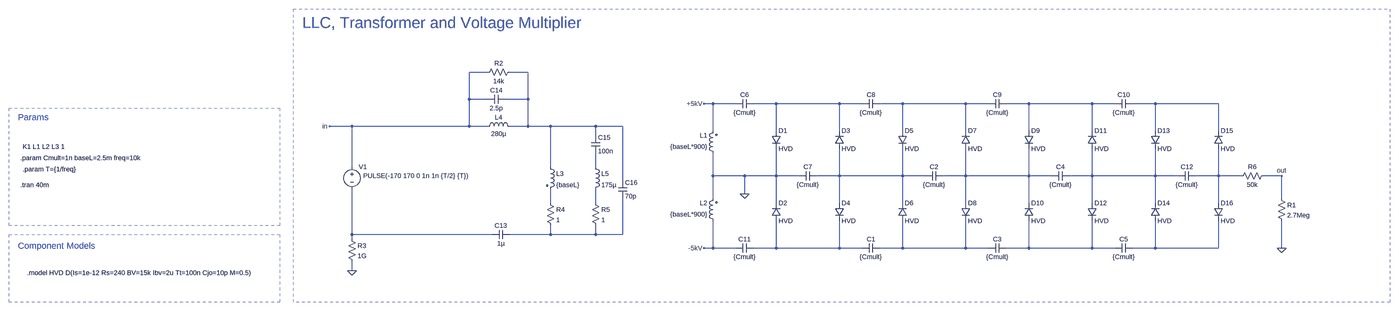
[diagram p0: schematic LLC_Parasitics_Multiplier.asc, whole sheet]
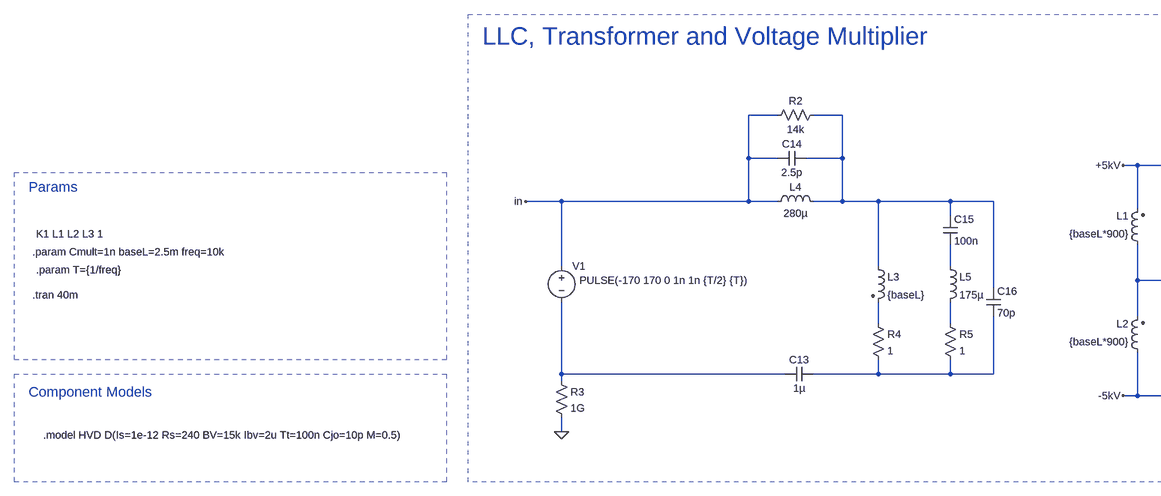
[diagram p1: schematic LLC_Parasitics_Multiplier.asc, part, row 1 of 1, column 1 of 2]
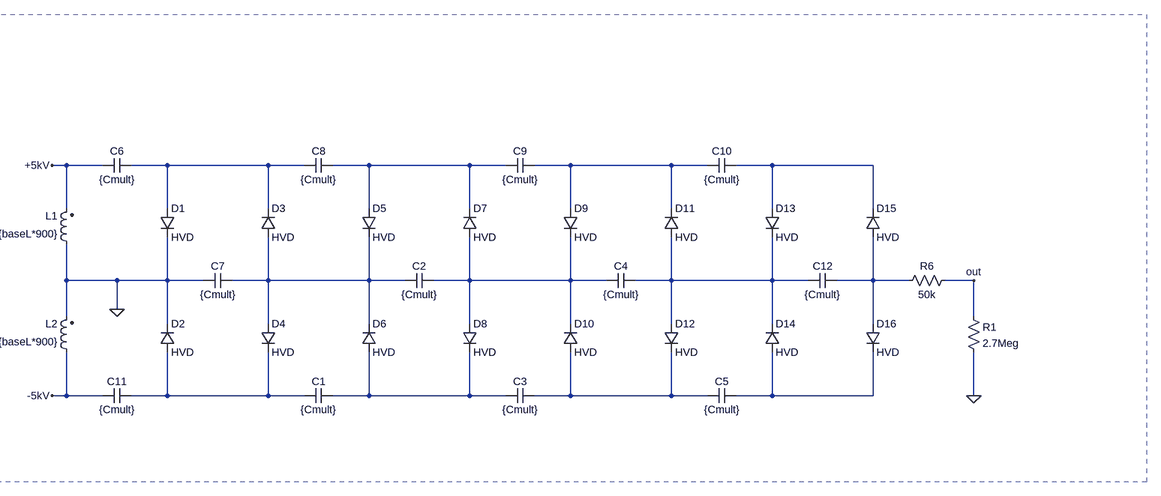
[diagram p2: schematic LLC_Parasitics_Multiplier.asc, part, row 1 of 1, column 2 of 2]
LLC_Parasitics_Multiplier.asc, the LTspice schematic file:
Version 4.1
SHEET 1 2716 1108
WIRE -784 -144 -848 -144
WIRE -640 -144 -704 -144
WIRE -848 -48 -848 -144
WIRE -784 -48 -848 -48
WIRE -640 -48 -640 -144
WIRE -640 -48 -720 -48
WIRE 16 -32 -16 -32
WIRE 96 -32 16 -32
WIRE 240 -32 160 -32
WIRE 464 -32 240 -32
WIRE 544 -32 464 -32
WIRE 688 -32 608 -32
WIRE 912 -32 688 -32
WIRE 992 -32 912 -32
WIRE 1136 -32 1056 -32
WIRE 1360 -32 1136 -32
WIRE 1440 -32 1360 -32
WIRE 1584 -32 1504 -32
WIRE 1808 -32 1584 -32
WIRE -1264 48 -1344 48
WIRE -848 48 -848 -48
WIRE -848 48 -1264 48
WIRE -784 48 -848 48
WIRE -640 48 -640 -48
WIRE -640 48 -704 48
WIRE -560 48 -640 48
WIRE -400 48 -560 48
WIRE -304 48 -400 48
WIRE 16 64 16 -32
WIRE 240 64 240 -32
WIRE 464 64 464 -32
WIRE 688 64 688 -32
WIRE 912 64 912 -32
WIRE 1136 64 1136 -32
WIRE 1360 64 1360 -32
WIRE 1584 64 1584 -32
WIRE 1808 64 1808 -32
WIRE -400 80 -400 48
WIRE -1264 192 -1264 48
WIRE -560 192 -560 48
WIRE -400 192 -400 144
WIRE 16 224 16 144
WIRE 128 224 16 224
WIRE 240 224 240 128
WIRE 240 224 128 224
WIRE 320 224 240 224
WIRE 464 224 464 128
WIRE 464 224 384 224
WIRE 688 224 688 128
WIRE 688 224 464 224
WIRE 768 224 688 224
WIRE 912 224 912 128
WIRE 912 224 832 224
WIRE 1136 224 1136 128
WIRE 1136 224 912 224
WIRE 1216 224 1136 224
WIRE 1360 224 1360 128
WIRE 1360 224 1280 224
WIRE 1584 224 1584 128
WIRE 1584 224 1360 224
WIRE 1664 224 1584 224
WIRE 1808 224 1808 128
WIRE 1808 224 1728 224
WIRE 1888 224 1808 224
WIRE 2032 224 1968 224
WIRE -304 240 -304 48
WIRE 128 288 128 224
WIRE 16 304 16 224
WIRE 2032 304 2032 224
WIRE -560 320 -560 272
WIRE -400 320 -400 272
WIRE 240 320 240 224
WIRE 464 320 464 224
WIRE 688 320 688 224
WIRE 912 320 912 224
WIRE 1136 320 1136 224
WIRE 1360 320 1360 224
WIRE 1584 320 1584 224
WIRE 1808 320 1808 224
WIRE -1264 432 -1264 272
WIRE -768 432 -1264 432
WIRE -560 432 -560 400
WIRE -560 432 -704 432
WIRE -400 432 -400 400
WIRE -400 432 -560 432
WIRE -304 432 -304 304
WIRE -304 432 -400 432
WIRE -1264 448 -1264 432
WIRE 16 480 16 384
WIRE 16 480 -16 480
WIRE 96 480 16 480
WIRE 240 480 240 384
WIRE 240 480 160 480
WIRE 464 480 464 384
WIRE 464 480 240 480
WIRE 544 480 464 480
WIRE 688 480 688 384
WIRE 688 480 608 480
WIRE 912 480 912 384
WIRE 912 480 688 480
WIRE 992 480 912 480
WIRE 1136 480 1136 384
WIRE 1136 480 1056 480
WIRE 1360 480 1360 384
WIRE 1360 480 1136 480
WIRE 1440 480 1360 480
WIRE 1584 480 1584 384
WIRE 1584 480 1504 480
WIRE 1808 480 1808 384
WIRE 1808 480 1584 480
WIRE 2032 480 2032 384
WIRE -1264 560 -1264 528
FLAG 2032 480 0
FLAG 128 288 0
FLAG -1344 48 in
FLAG 2032 224 out
FLAG -1264 560 0
FLAG -16 -32 +5kV
FLAG -16 480 -5kV
SYMBOL cap 608 464 R90
WINDOW 0 0 32 VBottom 2
WINDOW 3 32 32 VTop 2
SYMATTR InstName C1
SYMATTR Value {Cmult}
SYMBOL cap 832 240 M270
WINDOW 0 32 32 VTop 2
WINDOW 3 0 32 VBottom 2
SYMATTR InstName C2
SYMATTR Value {Cmult}
SYMBOL cap 1056 464 R90
WINDOW 0 0 32 VBottom 2
WINDOW 3 32 32 VTop 2
SYMATTR InstName C3
SYMATTR Value {Cmult}
SYMBOL res 2016 288 R0
SYMATTR InstName R1
SYMATTR Value 2.7Meg
SYMBOL cap 1280 240 M270
WINDOW 0 32 32 VTop 2
WINDOW 3 0 32 VBottom 2
SYMATTR InstName C4
SYMATTR Value {Cmult}
SYMBOL cap 1504 464 R90
WINDOW 0 0 32 VBottom 2
WINDOW 3 32 32 VTop 2
SYMATTR InstName C5
SYMATTR Value {Cmult}
SYMBOL cap 96 -16 R270
WINDOW 0 32 32 VTop 2
WINDOW 3 0 32 VBottom 2
SYMATTR InstName C6
SYMATTR Value {Cmult}
SYMBOL cap 384 208 R90
WINDOW 0 0 32 VBottom 2
WINDOW 3 32 32 VTop 2
SYMATTR InstName C7
SYMATTR Value {Cmult}
SYMBOL cap 608 -48 R90
WINDOW 0 0 32 VBottom 2
WINDOW 3 32 32 VTop 2
SYMATTR InstName C8
SYMATTR Value {Cmult}
SYMBOL cap 1056 -48 R90
WINDOW 0 0 32 VBottom 2
WINDOW 3 32 32 VTop 2
SYMATTR InstName C9
SYMATTR Value {Cmult}
SYMBOL cap 1504 -48 R90
WINDOW 0 0 32 VBottom 2
WINDOW 3 32 32 VTop 2
SYMATTR InstName C10
SYMATTR Value {Cmult}
SYMBOL cap 96 496 R270
WINDOW 0 32 32 VTop 2
WINDOW 3 0 32 VBottom 2
SYMATTR InstName C11
SYMATTR Value {Cmult}
SYMBOL cap 1728 240 M270
WINDOW 0 32 32 VTop 2
WINDOW 3 0 32 VBottom 2
SYMATTR InstName C12
SYMATTR Value {Cmult}
SYMBOL ind2 32 160 R180
WINDOW 0 36 80 Left 2
WINDOW 3 36 40 Left 2
SYMATTR InstName L1
SYMATTR Value {baseL*900}
SYMATTR Type ind
SYMBOL ind2 32 400 R180
WINDOW 0 36 80 Left 2
WINDOW 3 36 40 Left 2
SYMATTR InstName L2
SYMATTR Value {baseL*900}
SYMATTR Type ind
SYMBOL ind2 -576 176 R0
SYMATTR InstName L3
SYMATTR Value {baseL}
SYMATTR Type ind
SYMATTR SpiceLine Rser=1
SYMBOL diode 224 64 R0
SYMATTR InstName D1
SYMATTR Value HVD
SYMBOL diode 224 384 M180
WINDOW 0 24 64 Left 2
WINDOW 3 24 0 Left 2
SYMATTR InstName D2
SYMATTR Value HVD
SYMBOL diode 448 128 M180
WINDOW 0 24 64 Left 2
WINDOW 3 24 0 Left 2
SYMATTR InstName D3
SYMATTR Value HVD
SYMBOL diode 448 320 R0
SYMATTR InstName D4
SYMATTR Value HVD
SYMBOL diode 672 64 R0
SYMATTR InstName D5
SYMATTR Value HVD
SYMBOL diode 672 384 M180
WINDOW 0 24 64 Left 2
WINDOW 3 24 0 Left 2
SYMATTR InstName D6
SYMATTR Value HVD
SYMBOL diode 896 128 M180
WINDOW 0 24 64 Left 2
WINDOW 3 24 0 Left 2
SYMATTR InstName D7
SYMATTR Value HVD
SYMBOL diode 896 320 R0
SYMATTR InstName D8
SYMATTR Value HVD
SYMBOL diode 1120 64 R0
SYMATTR InstName D9
SYMATTR Value HVD
SYMBOL diode 1120 384 M180
WINDOW 0 24 64 Left 2
WINDOW 3 24 0 Left 2
SYMATTR InstName D10
SYMATTR Value HVD
SYMBOL diode 1344 128 M180
WINDOW 0 24 64 Left 2
WINDOW 3 24 0 Left 2
SYMATTR InstName D11
SYMATTR Value HVD
SYMBOL diode 1344 320 R0
SYMATTR InstName D12
SYMATTR Value HVD
SYMBOL diode 1568 64 R0
SYMATTR InstName D13
SYMATTR Value HVD
SYMBOL diode 1568 384 M180
WINDOW 0 24 64 Left 2
WINDOW 3 24 0 Left 2
SYMATTR InstName D14
SYMATTR Value HVD
SYMBOL diode 1792 128 M180
WINDOW 0 24 64 Left 2
WINDOW 3 24 0 Left 2
SYMATTR InstName D15
SYMATTR Value HVD
SYMBOL diode 1792 320 R0
SYMATTR InstName D16
SYMATTR Value HVD
SYMBOL ind -800 64 R270
WINDOW 0 32 56 VTop 2
WINDOW 3 5 56 VBottom 2
SYMATTR InstName L4
SYMATTR Value 280µ
SYMATTR SpiceLine Rser=1m
SYMBOL cap -704 416 R90
WINDOW 0 0 32 VBottom 2
WINDOW 3 32 32 VTop 2
SYMATTR InstName C13
SYMATTR Value 1µ
SYMBOL voltage -1264 176 R0
WINDOW 3 40 48 Left 2
WINDOW 123 0 0 Left 0
WINDOW 39 0 0 Left 0
SYMATTR Value PULSE(-170 170 0 1n 1n {T/2} {T})
SYMATTR InstName V1
SYMBOL res -1280 432 R0
SYMATTR InstName R3
SYMATTR Value 1G
SYMBOL res -576 304 R0
SYMATTR InstName R4
SYMATTR Value 1
SYMBOL cap -720 -64 R90
WINDOW 0 0 32 VBottom 2
WINDOW 3 32 32 VTop 2
SYMATTR InstName C14
SYMATTR Value 2.5p
SYMBOL res -688 -160 R90
WINDOW 0 0 56 VBottom 2
WINDOW 3 32 56 VTop 2
SYMATTR InstName R2
SYMATTR Value 14k
SYMBOL cap -416 80 R0
SYMATTR InstName C15
SYMATTR Value 100n
SYMBOL ind -416 176 R0
SYMATTR InstName L5
SYMATTR Value 175µ
SYMATTR SpiceLine Rser=1m
SYMBOL res -416 304 R0
SYMATTR InstName R5
SYMATTR Value 1
SYMBOL cap -320 240 R0
SYMATTR InstName C16
SYMATTR Value 70p
SYMBOL res 1984 208 R90
WINDOW 0 0 56 VBottom 2
WINDOW 3 32 56 VTop 2
SYMATTR InstName R6
SYMATTR Value 50k
TEXT -1440 -320 Left 5 ;LLC, Transformer and Voltage Multiplier
TEXT -2432 120 Left 2 !K1 L1 L2 L3 1
TEXT -2440 160 Left 2 !.param Cmult=1n baseL=2.5m freq=10k
TEXT -2416 568 Left 2 !.model HVD D(Is=1e-12 Rs=240 BV=15k Ibv=2u Tt=100n Cjo=10p M=0.5)
TEXT -2448 16 Left 3 ;Params
TEXT -2448 472 Left 3 ;Component Models
TEXT -2440 256 Left 2 !.tran 40m
TEXT -2432 200 Left 2 !.param T={1/freq}
RECTANGLE Normal -1520 400 -2480 -16 1
RECTANGLE Normal -1520 672 -2480 432 1
RECTANGLE Normal 2416 672 -1472 -368 1

The netlist it stands for:
* LLC_Parasitics_Multiplier.asc
C1 N016 N015 {Cmult}
C2 N008 N007 {Cmult}
C3 N017 N016 {Cmult}
R1 out 0 2.7Meg
C4 N009 N008 {Cmult}
C5 N018 N017 {Cmult}
C6 +5kV N002 {Cmult}
C7 N007 0 {Cmult}
C8 N003 N002 {Cmult}
C9 N004 N003 {Cmult}
C10 N005 N004 {Cmult}
C11 -5kV N015 {Cmult}
C12 N010 N009 {Cmult}
L1 0 +5kV {baseL*900}
L2 -5kV 0 {baseL*900}
L3 N001 N011 {baseL} Rser=1
D1 N002 0 HVD
D2 N015 0 HVD
D3 N007 N002 HVD
D4 N007 N015 HVD
D5 N003 N007 HVD
D6 N016 N007 HVD
D7 N008 N003 HVD
D8 N008 N016 HVD
D9 N004 N008 HVD
D10 N017 N008 HVD
D11 N009 N004 HVD
D12 N009 N017 HVD
D13 N005 N009 HVD
D14 N018 N009 HVD
D15 N010 N005 HVD
D16 N010 N018 HVD
L4 in N001 280µ Rser=1m
C13 N014 N013 1µ
V1 in N013 PULSE(-170 170 0 1n 1n {T/2} {T})
R3 N013 0 1G
R4 N011 N014 1
C14 N001 in 2.5p
R2 N001 in 14k
C15 N001 N006 100n
L5 N006 N012 175µ Rser=1m
R5 N012 N014 1
C16 N001 N014 70p
R6 out N010 50k
.model D D
.lib standard.dio
* LLC, Transformer and Voltage Multiplier
K1 L1 L2 L3 1
.param Cmult=1n baseL=2.5m freq=10k
.model HVD D(Is=1e-12 Rs=240 BV=15k Ibv=2u Tt=100n Cjo=10p M=0.5)
* Params
* Component Models
.tran 40m
.param T={1/freq}
.backanno
.end